# Altium project DC550200-1095-2H.PrjPcb
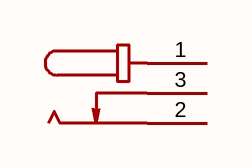
[diagram p0: DC550200-1095-2H.schdoc]
1 sheet, 1 parts. Net scope: global (net labels, ports and power ports of the same name join across sheets).

## Sheet DC550200-1095-2H.schdoc
size 127 x 101 mm

### Parts
DC?  dc550200-1095-2h  [DC-IN-TH_DC550200-1095-2H]  (value not drawn)

### Nets

Not connected (* = marked no-connect by the designer): DC? 1(+) 2(-) 3

### Library data of the parts
DC? = dc550200-1095-2h: 连接器类型:DC电源插座;安装方式:弯插;触点外径:6.4mm;额定电流:5A;额定电压:60V;; Manufacturer: HDGC(华德共创); AddInBom: yes; ModelId: 56d1b1affb614907a521073155fd6544; ModelTransform: 417.322,559.054,0,0,0,0,-84.643,-145.667,-118.11; Connector Type: DC电源插座; Outside Contact Diameter: 6.4mm; Current Rating: 5A; Voltage Rating (Max): 60V; Body Height: 11.5mm; Symbol: DC550200-1095-2H; LCSC Part Name: DC电源插座 外径:6.4mm; SupplierPart: C7587689; ManufacturerPart: DC550200-1095-2H; Supplier Footprint: 插件; JLCPCB Part Class: Extended Part; Datasheet: https://item.szlcsc.com/datasheet/DC550200-1095-2H/8703781.html; Supplier: LCSC; ConvertToPcb: yes; FootprintName: DC-IN-TH_DC550200-1095-2H; ModelName: DC-IN-TH_DC550200-1095-2H; Mounting Type: 弯插; Length: 14.2mm; Width: 10.6mm